# Altium project Ethernet-Tester-v1.0.PrjPcb (part 4 of 5)

## Sheet PoE-Sheet.SchDoc
size A4; SheetNumber: 8; SheetTotal: 9
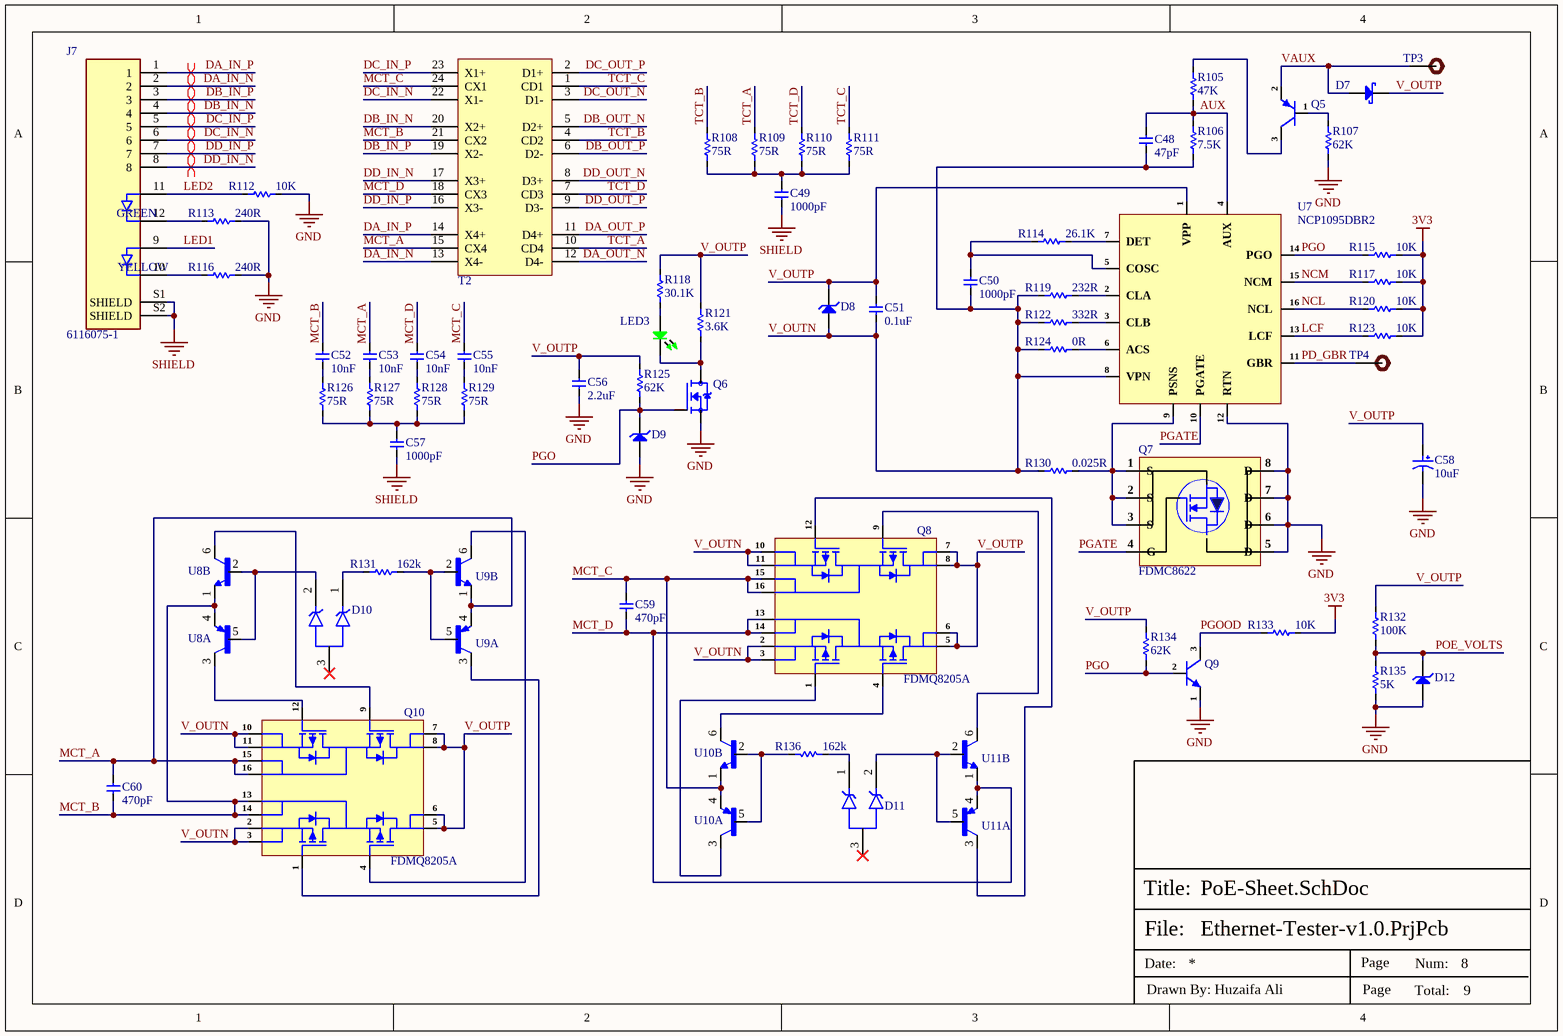
[diagram p7: PoE-Sheet.SchDoc]

### Parts
C48  47pF  [Cap-0603]
C49  1000pF  [Cap-1206]
C50  1000pF  [Cap-0603]
C51  0.1uF  [Cap-0805]
C52  10nF  [Cap-0402]
C53  10nF  [Cap-0402]
C54  10nF  [Cap-0402]
C55  10nF  [Cap-0402]
C56  2.2uF  [Cap-0805]
C57  1000pF  [Cap-1206]
C58  10uF  [EEE-FK1K100XP]
C59  470pF  [Cap-0805]
C60  470pF  [Cap-0805]
D7  SS26  [SMA(DO-214AC)]  (value not drawn)
D8  SMBJ58A-13-F  [SMB_]  (value not drawn)
D9  1SMA5930BT3G  [SMA]  (value not drawn)
D10  MMBZ27VALT1G  [SOT95P237X111-3N]  (value not drawn)
D11  MMBZ27VALT1G  [SOT95P237X111-3N]  (value not drawn)
D12  MM3Z3V3B  [SOD323F]  (value not drawn)
J7  6116075-1  [TE_6116075-1]
LED3  Emerald  [LED-0603]  (value not drawn)
Q5  BC856B  [SOT-23]  (value not drawn)
Q6  2N7002LT1G  [SOT95P240X111-3N]  (value not drawn)
Q7  FDMC8622  [8-MLP (3.3x3.3)]
Q8  FDMQ8205A  [12-MLP (5x4.5)]
Q9  MMBT3904  [SOT-23]  (value not drawn)
Q10  FDMQ8205A  [12-MLP (5x4.5)]
R105  47K  [Res-0402]
R106  7.5K  [Res-0402]
R107  62K  [Res-0603]
R108  75R  [Res-0402]
R109  75R  [Res-0402]
R110  75R  [Res-0402]
R111  75R  [Res-0402]
R112  10K  [Res-0402]
R113  240R  [Res-0402]
R114  26.1K  [Res-0402]
R115  10K  [Res-0402]
R116  240R  [Res-0402]
R117  10K  [Res-0402]
R118  30.1K  [Res-0603]
R119  232R  [Res-0402]
R120  10K  [Res-0402]
R121  3.6K  [Res-1206]
R122  332R  [Res-0402]
R123  10K  [Res-0402]
R124  0R  [Res-0402]
R125  62K  [Res-0603]
R126  75R  [Res-0402]
R127  75R  [Res-0402]
R128  75R  [Res-0402]
R129  75R  [Res-0402]
R130  0.025R  [Res-1206]
R131  162k  [Res-0402]
R132  100K  [Res-0402]
R133  10K  [Res-0402]
R134  62K  [Res-0603]
R135  5K  [Res-0402]
R136  162k  [Res-0402]
T2  1000 Base-T, 1 Port  [7490220123]  (value not drawn)
TP3  0.5mm Test Pad  [0.5mm Test Pad]  (value not drawn)  (no BOM)
TP4  TEST POINT 0.5mm Dia  [Test-point - 0.5mm]  (value not drawn)  (no BOM)
U7  NCP1095DBR2  [TSSOP_16]
U8  BC846BPDW1T1G  [SOT65P210X110-6N]  (value not drawn)  (parts A,B of 2)
U9  BC846BPDW1T1G  [SOT65P210X110-6N]  (value not drawn)  (parts A,B of 2)
U10  BC846BPDW1T1G  [SOT65P210X110-6N]  (value not drawn)  (parts A,B of 2)
U11  BC846BPDW1T1G  [SOT65P210X110-6N]  (value not drawn)  (parts A,B of 2)

### Nets
3V3: R115.2 R117.2 R120.2 R123.2 R133.2
GND: C56.1 C58.2 D9.2(A) D12.1(A) Q6.2(S) Q7.5(D) Q7.6(D) Q7.7(D) Q7.8(D) Q9.1(E) R107.1 R112.2 R113.2 R116.2 R135.1 U7.12(RTN)
SHIELD: C49.1 C57.1 J7.S1(SHIELD) J7.S2(SHIELD)
AUX: C48.2 R105.1 R106.2 U7.4(AUX)
DA_IN_N: J7.2 T2.13(X4-)
DA_IN_P: J7.1 T2.14(X4+)
DA_OUT_N: T2.12(D4-)
DA_OUT_P: T2.11(D4+)
DB_IN_N: J7.4 T2.20(X2+)
DB_IN_P: J7.3 T2.19(X2-)
DB_OUT_N: T2.5(D2+)
DB_OUT_P: T2.6(D2-)
DC_IN_N: J7.6 T2.22(X1-)
DC_IN_P: J7.5 T2.23(X1+)
DC_OUT_N: T2.3(D1-)
DC_OUT_P: T2.2(D1+)
DD_IN_N: J7.8 T2.17(X3+)
DD_IN_P: J7.7 T2.16(X3-)
DD_OUT_N: T2.8(D3+)
DD_OUT_P: T2.9(D3-)
LCF: R123.1 U7.13(LCF)
LED1: J7.9(LED_YELLOW_ANODE)
LED2: J7.11(LED_GREEN_ANODE) R112.1
MCT_A: C53.2 C60.2 Q10.15(INPUT2) Q10.16(INPUT2) T2.15(CX4) U9.1(E2) U9.4(E1)
MCT_B: C52.2 C60.1 Q10.13(INPUT1) Q10.14(INPUT1) T2.21(CX2) U8.1(E2) U8.4(E1)
MCT_C: C55.2 C59.2 Q8.15(INPUT2) Q8.16(INPUT2) T2.24(CX1) U10.1(E2) U10.4(E1)
MCT_D: C54.2 C59.1 Q8.13(INPUT1) Q8.14(INPUT1) T2.18(CX3) U11.1(E2) U11.4(E1)
NCL: R120.1 U7.16(NCL)
NCM: R117.1 U7.15(NCM)
PD_GBR: TP4.1 U7.11(GBR)
PGATE: Q7.4(G) U7.10(PGATE)
PGO: D9.1(K) Q6.1(G) Q9.2(B) R115.1 R125.1 R134.2 U7.14(PGO)
PGOOD: Q9.3(C) R133.1
POE_VOLTS: D12.2(K) R132.1 R135.2
TCT_A: R109.2 T2.10(CD4)
TCT_B: R108.2 T2.4(CD2)
TCT_C: R111.2 T2.1(CD1)
TCT_D: R110.2 T2.7(CD3)
V_OUTN: C48.1 C50.1 C51.1 D8.1(A) Q8.2(OUTN) Q8.3(OUTN) Q8.10(OUTN) Q8.11(OUTN) Q10.2(OUTN) Q10.3(OUTN) Q10.10(OUTN) Q10.11(OUTN) R106.1 R119.1 R122.1 R124.1 R130.1 U7.8(VPN)
V_OUTP: C51.2 C56.2 C58.1 D7.1(K) D8.2(K) Q8.5(OUTP) Q8.6(OUTP) Q8.7(OUTP) Q8.8(OUTP) Q10.5(OUTP) Q10.6(OUTP) Q10.7(OUTP) Q10.8(OUTP) R118.2 R121.2 R125.2 R132.2 R134.1 U7.1(VPP)
VAUX: D7.2(A) Q5.2(E) TP3.1
NetC49_2: C49.2 R108.1 R109.1 R110.1 R111.1
NetC50_2: C50.2 R114.1 U7.5(COSC)
NetC52_1: C52.1 R126.2
NetC53_1: C53.1 R127.2
NetC54_1: C54.1 R128.2
NetC55_1: C55.1 R129.2
NetC57_2: C57.2 R126.1 R127.1 R128.1 R129.1
NetD10_1: D10.1(K1) R131.1
NetD10_2: D10.2(K2) U8.2(B2) U8.5(B1)
NetD11_1: D11.1(K1) R136.1
NetD11_2: D11.2(K2) U11.2(B2) U11.5(B1)
NetJ7_10: J7.10(LED_YELLOW_CATHODE) R116.1
NetJ7_12: J7.12(LED_GREEN_CATHODE) R113.1
NetLED3_1: LED3.1 R118.1
NetLED3_2: LED3.2 Q6.3(D) R121.1
NetQ5_1: Q5.1(B) R107.2
NetQ5_3: Q5.3(C) R105.2
NetQ7_1: Q7.1(S) Q7.2(S) Q7.3(S) R130.2 U7.9(PSNS)
NetQ8_1: Q8.1(G1) U10.3(C1)
NetQ8_4: Q8.4(G2) U10.6(C2)
NetQ8_9: Q8.9(G3) U11.6(C2)
NetQ8_12: Q8.12(G4) U11.3(C1)
NetQ10_1: Q10.1(G1) U9.3(C1)
NetQ10_4: Q10.4(G2) U9.6(C2)
NetQ10_9: Q10.9(G3) U8.6(C2)
NetQ10_12: Q10.12(G4) U8.3(C1)
NetR114_2: R114.2 U7.7(DET)
NetR119_2: R119.2 U7.2(CLA)
NetR122_2: R122.2 U7.3(CLB)
NetR124_2: R124.2 U7.6(ACS)
NetR131_2: R131.2 U9.2(B2) U9.5(B1)
NetR136_2: R136.2 U10.2(B2) U10.5(B1)

Not connected (* = marked no-connect by the designer): D10 3(A)*; D11 3(A)*

### Layout directives
differential pair: DA_IN_N, DA_IN_P, DB_IN_N, DB_IN_P, DC_IN_N, DC_IN_P, DD_IN_N, DD_IN_P

### Notes on the sheet
- File:
- Title:
- Date:
- Page
- Num:
- Total:
- Drawn By: Huzaifa Ali
- (in symbol 6116075-1) GREEN; YELLOW

### Library data of the parts
C48 = CC0603FRNPO9BN470: CAP CER 47PF 50V NPO 0603; Manufacturer: Yageo; Item Type: Capacitor; Supplier: Digikey; LCSC Part Number: C519486; Manufacturer Part Number: CC0603FRNPO9BN470; RoHS: Yes; Stock: 37282; Pricing: 1=0.19, 10=0.126, 50=0.0756, 100=0.0594, 500=0.0439, 1000=0.03634 (USD); ComponentLink1URL: https://datasheet.ciiva.com/5425/upy-gp-np0-16v-to-50v-8-5425545.pdf?src-supplier=Mouser; ComponentLink1Description: https://datasheet.ciiva.com/5425/upy-gp-np0-16v-to-50v-8-5425545.pdf?src-supplier=Mouser; ComponentLink2URL: https://datasheet.ciiva.com/11586/upy-gp-np0-16v-to-50v-8-11586472.pdf?src-supplier=Avnet; ComponentLink2Description: https://datasheet.ciiva.com/11586/upy-gp-np0-16v-to-50v-8-11586472.pdf?src-supplier=Avnet
C49 C57 = CC1206KKX7RDBB102: CAP CER 1000PF 2KV X7R 1206; Manufacturer: Yageo; Tolerance: 10%; Capacitance: 1nF; Dissipation Factor: 2.5%; Insulation Resistance: 10GR; Item Type: Capacitor; Supplier 1: Digi-Key; Manufacturer Part Number: CC1206KKX7RDBB102; RoHS: Yes; Category: Ceramic Capacitors; Stock 1: 19260; Pricing 1: 1=0.35000, 10=0.24000, 50=0.16780, 100=0.14390, 500=0.10794, 1000=0.09114 (USD); Mount: Surface Mount; Case/Package: 1206; Number of Pins: 2; Case Code (Metric): 3216; Case Code (Imperial): 1206; Min Operating Temperature: -55°C; Max Operating Temperature: 125°C; Dielectric: X7R; Voltage: 2kV; Package Quantity: 1; Voltage Rating: 2kV; Packaging: Tape and Reel; Voltage Rating (DC): 2kV; Termination: SMD/SMT; Resistor Type: Ceramic; Series: CC; Construction: Flat; Length: 3.2mm; Width: 0.063inch; Height: 1.25mm; Depth: 1.6mm; Thickness: 0.057inch; Radiation Hardening: No; RoHS Compliant: Yes; REACH SVHC: Unknown; Lead Free: Lead Free; ComponentLink1URL: https://datasheet.ciiva.com/23942/1449957-23942422.pdf?src-supplier=Newark; ComponentLink1Description: https://datasheet.ciiva.com/23942/1449957-23942422.pdf?src-supplier=Newark; ComponentLink2URL: https://datasheet.ciiva.com/186/upy-np0x7r-hv-1kv-to-3kv-4-186736.pdf?src-supplier=Digi-Key; ComponentLink2Description: https://datasheet.ciiva.com/186/upy-np0x7r-hv-1kv-to-3kv-4-186736.pdf?src-supplier=Digi-Key; ComponentLink3URL: https://datasheet.ciiva.com/186/upy-np0x7r-hv-1kv-to-3kv-4-186737.pdf?src-supplier=Digi-Key; ComponentLink3Description: https://datasheet.ciiva.com/186/upy-np0x7r-hv-1kv-to-3kv-4-186737.pdf?src-supplier=Digi-Key; ComponentLink4URL: https://datasheet.ciiva.com/13386/upy-gp-np0-16v-to-50v-8-13386312.pdf?src-supplier=Mouser; ComponentLink4Description: https://datasheet.ciiva.com/13386/upy-gp-np0-16v-to-50v-8-13386312.pdf?src-supplier=Mouser; ComponentLink5URL: https://datasheet.ciiva.com/186/upy-np0x7r-hv-1kv-to-3kv-4-186735.pdf?src-supplier=Digi-Key; ComponentLink5Description: https://datasheet.ciiva.com/186/upy-np0x7r-hv-1kv-to-3kv-4-186735.pdf?src-supplier=Digi-Key; Supplier Part Number 1: 311-1487-1-ND; LCSC Part Number: C23631
C50 = CL10C102JB8NNNC: CAP CER 1000PF 50V C0G/NP0 0603; Manufacturer: Samsung; Material: Ceramic; Tolerance: 5%; Capacitance: 1nF; Dielectric: C0G; Temperature Coefficient: 300ppm/°C; Item Type: Capacitor; Supplier 1: RSComponents; Manufacturer Part Number: CL10C102JB8NNNC; RoHS: Yes; Category: Ceramic Capacitors; Stock 1: 616000; Pricing 1: 4000=0.00600, 12000=0.00600, 20000=0.00600, 40000=0.00500, 100000=0.00500 (GBP); Mount: Surface Mount; Case/Package: 0603; Case Code (Metric): 1608; Case Code (Imperial): 0603; Min Operating Temperature: -55°C; Max Operating Temperature: 125°C; Voltage: 50V; Voltage Rating (DC): 50V; Voltage Rating: 50V; Packaging: Tape and Reel; Package Quantity: 1; Series: CL; Length: 1.6mm; Width: 0.031inch; Height: 0.8mm; Depth: 0.8mm; Thickness: 0.035inch; Radiation Hardening: No; Lead Free: Lead Free; RoHS Compliant: Yes; ComponentLink1URL: https://datasheet.ciiva.com/15195/getdatasheetpartid-354056-15195790.pdf?src-supplier=Verical; ComponentLink1Description: https://datasheet.ciiva.com/15195/getdatasheetpartid-354056-15195790.pdf?src-supplier=Verical; ComponentLink2URL: https://datasheet.ciiva.com/29198/458273-da-01-en-vs-kondensator-0603-29198494.pdf?src-supplier=Conrad; ComponentLink2Description: https://datasheet.ciiva.com/29198/458273-da-01-en-vs-kondensator-0603-29198494.pdf?src-supplier=Conrad; ComponentLink3URL: https://datasheet.ciiva.com/26310/mlcc-catalogdownload2013-eng-26310329.pdf?src-supplier=Distrelec; ComponentLink3Description: https://datasheet.ciiva.com/26310/mlcc-catalogdownload2013-eng-26310329.pdf?src-supplier=Distrelec; Supplier Part Number 1: 7665279; LCSC Part Number: C163508
C51 = CC0805KKX7R0BB104: CAP CER 0.1UF 100V X7R 0805; Manufacturer: Yageo; Item Type: Capacitor; Tolerance: 10%; Value: 100nF; Supplier: Digikey; LCSC Part Number: C106243; Manufacturer Part Number: CC0805KKX7R0BB104; RoHS: Yes; Stock: 52345; Pricing: 1=0.19, 10=0.126, 50=0.0756, 100=0.0594, 500=0.0439, 1000=0.03634 (USD); Mounting Technology: Surface Mount; Case/Package: 0805; Case Code (Imperial): 0805; Case Code (Metric): 2012; Weight: 0.000194oz; Min Operating Temperature: -55°C; Max Operating Temperature: 125°C; Dielectric: X7R; Packaging: Tape and Reel; Voltage Rating (DC): 100V; Voltage Rating: 100V; Termination: SMD/SMT; Voltage: 100V; Series: CC; Lead Free: Lead Free; RoHS Compliant: Yes; ComponentLink1URL: https://media.digikey.com/pdf/Data%20Sheets/Yageo%20PDFs/NPO,%20X7R%20Mid-voltage.pdf?src-supplier=Digikey; ComponentLink1Description: https://media.digikey.com/pdf/Data%20Sheets/Yageo%20PDFs/NPO,%20X7R%20Mid-voltage.pdf?src-supplier=Digikey; ComponentLink2URL: http://www.mouser.com/ds/2/447/Yageo_UPY-GP_NP0_16V-to-50V_9-358835.pdf?src-supplier=Mouser; ComponentLink2Description: http://www.mouser.com/ds/2/447/Yageo_UPY-GP_NP0_16V-to-50V_9-358835.pdf?src-supplier=Mouser; ComponentLink3URL: http://www.yageo.com/documents/recent/UPY-NP0X7R_MV_100-to-630V_21.pdf?src-supplier=Digikey; ComponentLink3Description: http://www.yageo.com/documents/recent/UPY-NP0X7R_MV_100-to-630V_21.pdf?src-supplier=Digikey; ComponentLink4URL: https://datasheet.octopart.com/CC0805KKX7R0BB104-Yageo-datasheet-101324229.pdf?src-supplier=Newark; ComponentLink4Description: https://datasheet.octopart.com/CC0805KKX7R0BB104-Yageo-datasheet-101324229.pdf?src-supplier=Newark; ComponentLink5URL: https://datasheet.octopart.com/CC0805KKX7R0BB104-Yageo-datasheet-166511530.pdf?src-supplier=Future+Electronics; ComponentLink5Description: https://datasheet.octopart.com/CC0805KKX7R0BB104-Yageo-datasheet-166511530.pdf?src-supplier=Future+Electronics
C52-C55 = CC0402KRX7R0BB103: CAP CER 10000PF 100V X7R 0402; Manufacturer: Yageo; Item Type: Capacitors; Material: Ceramic; Tolerance: 10%; Supplier: Arrow Electronics; LCSC Part Number: C527014; Manufacturer Part Number: CC0402KRX7R0BB103; RoHS: Yes; Stock: 60000; Pricing: 10000=0.0098, 20000=0.0097, 30000=0.0092, 50000=0.0091, 100000=0.009, 250000=0.0089 (USD); Case/Package: 0402; Min Operating Temperature: -55°C; Max Operating Temperature: 125°C; Value: 10nF; Voltage Rating: 100V; Height: 550um; RoHS Compliant: Yes; ComponentLink1URL: https://datasheet.octopart.com/CC0402KRX7R0BB103-Yageo-datasheet-166511530.pdf?src-supplier=Future+Electronics; ComponentLink1Description: https://datasheet.octopart.com/CC0402KRX7R0BB103-Yageo-datasheet-166511530.pdf?src-supplier=Future+Electronics; ComponentLink2URL: https://datasheet.octopart.com/CC0402KRX7R0BB103-Yageo-datasheet-153410991.pdf?src-supplier=Farnell; ComponentLink2Description: https://datasheet.octopart.com/CC0402KRX7R0BB103-Yageo-datasheet-153410991.pdf?src-supplier=Farnell
C56 = GRM21BD72A225KE01L: CAP CER 2.2UF 100V X7T 0805; Manufacturer: Murata; Item Type: Capacitor; Supplier 1: Digi-Key; Manufacturer Part Number: GRM21BD72A225KE01L; RoHS: No; Category: Ceramic Capacitors; Stock 1: 2439; Pricing 1: 1=0.55000, 10=0.38600, 50=0.29220, 100=0.25440, 500=0.18846, 1000=0.16020 (USD); RoHS Compliant: Yes; LCSC Part Number: C2981733; ComponentLink1Description: LCSC; ComponentLink1URL: https://www.lcsc.com/product-detail/Multilayer-Ceramic-Capacitors-MLCC-SMD-SMT_Murata-Electronics-GRM21BD72A225KE01L_C2981733.html; Supplier Part Number 1: 490-GRM21BD72A225KE01LCT-ND
C58 = EEE-FK1K100XP: CAP ALUM 10UF 20% 80V SMD; Manufacturer: Panasonic; Item Type: Capacitors; Supplier: Mouser; LCSC Part Number: C178553; Manufacturer Part Number: EEE-FK1K100XP; RoHS: Yes; Stock: 3728; Pricing: 1=0.68, 10=0.368, 50=0.368, 100=0.277, 1000=0.185, 10000=0.157 (USD); ComponentLink1URL: https://datasheet.ciiva.com/11783/0900766b80e4e8b0-11783480.pdf?src-supplier=Rs; ComponentLink1Description: https://datasheet.ciiva.com/11783/0900766b80e4e8b0-11783480.pdf?src-supplier=Rs; ComponentLink2URL: https://datasheet.ciiva.com/48523/fk-eng-tds-48523894.pdf?src-supplier=Distrelec; ComponentLink2Description: https://datasheet.ciiva.com/48523/fk-eng-tds-48523894.pdf?src-supplier=Distrelec; ComponentLink3URL: https://datasheet.ciiva.com/28670/731857-28670589.pdf?src-supplier=Element14; ComponentLink3Description: https://datasheet.ciiva.com/28670/731857-28670589.pdf?src-supplier=Element14; ComponentLink4URL: https://datasheet.ciiva.com/14602/70258115-14602415.pdf?src-supplier=Allied+Electronics; ComponentLink4Description: https://datasheet.ciiva.com/14602/70258115-14602415.pdf?src-supplier=Allied+Electronics; ComponentLink5URL: https://datasheet.ciiva.com/14606/70258115-14606165.pdf?src-supplier=Allied+Electronics; ComponentLink5Description: https://datasheet.ciiva.com/14606/70258115-14606165.pdf?src-supplier=Allied+Electronics; ComponentLink6URL: https://datasheet.ciiva.com/2985/aba0000ce120-2985457.pdf?src-supplier=Avnet; ComponentLink6Description: https://datasheet.ciiva.com/2985/aba0000ce120-2985457.pdf?src-supplier=Avnet; ComponentLink7URL: https://datasheet.ciiva.com/6121/1676921-6121193.pdf?src-supplier=Farnell; ComponentLink7Description: https://datasheet.ciiva.com/6121/1676921-6121193.pdf?src-supplier=Farnell; ComponentLink8URL: https://datasheet.ciiva.com/15166/getdatasheetpartid-191532-15166315.pdf?src-supplier=Verical; ComponentLink8Description: https://datasheet.ciiva.com/15166/getdatasheetpartid-191532-15166315.pdf?src-supplier=Verical
C59 C60 = CC0805KRX7RBBB471: CAP CER 470PF 500V X7R 0805; Manufacturer: Yageo; Item Type: Capacitors; Tolerance: 10%; Supplier: Arrow Electronics; LCSC Part Number: C113867; Manufacturer Part Number: CC0805KRX7RBBB471; RoHS: Yes; Stock: 16000; Pricing: 4000=0.0157, 8000=0.0139, 24000=0.013, 48000=0.0125, 100000=0.0094 (USD); Mounting Technology: Surface Mount; Case/Package: 0805; Case Code (Imperial): 0805; Case Code (Metric): 2012; Min Operating Temperature: -55°C; Max Operating Temperature: 125°C; Voltage Rating (DC): 500V; Value: 470pF; Packaging: Tape and Reel; Package Quantity: 4000; Dielectric: X7R; Voltage Rating: 500V; Series: CC; Length: 0.079inch; Width: 0.049inch; Thickness: 0.037inch; RoHS Compliant: Yes; ComponentLink1URL: http://www.mouser.com/ds/2/447/Yageo_UPY-GP_NP0_16V-to-50V_9-358835.pdf?src-supplier=Mouser; ComponentLink1Description: http://www.mouser.com/ds/2/447/Yageo_UPY-GP_NP0_16V-to-50V_9-358835.pdf?src-supplier=Mouser; ComponentLink2URL: https://www.yageo.com/upload/media/product/products/datasheet/mlcc/UPY-NP0X7R_MV_100-to-630V_21.pdf?src-supplier=Digikey; ComponentLink2Description: https://www.yageo.com/upload/media/product/products/datasheet/mlcc/UPY-NP0X7R_MV_100-to-630V_21.pdf?src-supplier=Digikey; ComponentLink3URL: http://www.yageo.com/documents/recent/UPY-NP0X7R_MV_100-to-630V_19.pdf?src-supplier=Digikey; ComponentLink3Description: http://www.yageo.com/documents/recent/UPY-NP0X7R_MV_100-to-630V_19.pdf?src-supplier=Digikey
D7 = SS26: 60V 700mV@2A 2A SMA(DO-214AC) Schottky Barrier Diodes (SBD) ROHS; Manufacturer: MDD; Item Type: Diode; Manufacturer Part Number: SS26; Package: SMA(DO-214AC); LCSC Part Number: C14238; ComponentLink1Description: LCSC; ComponentLink1URL: https://www.lcsc.com/product-detail/Schottky-Barrier-Diodes-SBD_MDD-Microdiode-Electronics-SS26_C14238.html
D8 = SMBJ58A-13-F: TVS DIODE 58VWM 93.6VC SMB; Manufacturer: Diodes; Supplier: Future Electronics; LCSC Part Number: C135085; Manufacturer Part Number: SMBJ58A-13-F; RoHS: Yes; Item Type: Diode; Stock: 6000; Pricing: 3000=0.0711, 9000=0.0684, 15000=0.0671, 30000=0.0655, 60000=0.063 (USD); ComponentLink1URL: https://datasheet.ciiva.com/25624/0900766b8104bed2-25624843.pdf?src-supplier=Rs; ComponentLink1Description: https://datasheet.ciiva.com/25624/0900766b8104bed2-25624843.pdf?src-supplier=Rs; ComponentLink2URL: https://datasheet.ciiva.com/15143/getdatasheetpartid-39642-15143045.pdf?src-supplier=Verical; ComponentLink2Description: https://datasheet.ciiva.com/15143/getdatasheetpartid-39642-15143045.pdf?src-supplier=Verical; ComponentLink3URL: https://datasheet.ciiva.com/4520/ds19002-4520617.pdf?src-supplier=Mouser; ComponentLink3Description: https://datasheet.ciiva.com/4520/ds19002-4520617.pdf?src-supplier=Mouser; ComponentLink4URL: https://datasheet.ciiva.com/16393/ds19002-16393005.pdf?src-supplier=Future+Electronics; ComponentLink4Description: https://datasheet.ciiva.com/16393/ds19002-16393005.pdf?src-supplier=Future+Electronics
D9 = 1SMA5930BT3G: DIODE ZENER 16V 1.5W SMA; Manufacturer: onsemi; Item Type: Zener diode; Manufacturer Part Number: 1SMA5930BT3G; Package: SMA; LCSC Part Number: C128848; ComponentLink1Description: LCSC; ComponentLink1URL: https://www.lcsc.com/product-detail/Zener-Diodes_onsemi-1SMA5930BT3G_C128848.html
D10 D11 = MMBZ27VALT1G: 46V Clamp 870mA Ipp Tvs Diode Surface Mount SOT-23-3 (TO-236); Package: None; Price: None; Value: *; MP: MMBZ27VALT1G; Availability: Unavailable
D12 = MM3Z3V3B: DIODE ZENER 3.3V 200MW SOD323F; Manufacturer: ON Semiconductor / Fairchild; Forward Voltage: 1V; Tolerance: 2%; Impedance: 89R; Max Reverse Leakage Current: 4.5uA; Test Current: 5mA; Element Configuration: Single; Supplier 1: Digi-Key; Manufacturer Part Number: MM3Z3V3B; Stock 1: 473644; Pricing 1: 1=0.22, 10=0.18, 100=0.0956, 500=0.06288, 1000=0.04276 (USD); Mount: Surface Mount; Number of Pins: 2; Weight: 0.0276g; Min Operating Temperature: -65°C; Max Operating Temperature: 150°C; Packaging: Tape and Reel; Package Quantity: 1; Max Power Dissipation: 200mW; Zener Voltage: 3.3V; Voltage Tolerance: 2%; Power Dissipation: 200mW; Working Voltage: 3.3V; Peak Reverse Current: 4.5uA; Length: 1.3mm; Height: 1mm; Width: 1.7mm; Radiation Hardening: No; REACH SVHC: No SVHC; Lead Free: Lead Free; ComponentLink1URL: http://www.onsemi.com/pub/Collateral/MM3Z9V1B-D.pdf?src-supplier=Digi-Key; ComponentLink1Description: http://www.onsemi.com/pub/Collateral/MM3Z9V1B-D.pdf?src-supplier=Digi-Key; ComponentLink2URL: http://www.mouser.com/ds/2/149/MM3Z3V3B-187166.pdf?src-supplier=Mouser; ComponentLink2Description: http://www.mouser.com/ds/2/149/MM3Z3V3B-187166.pdf?src-supplier=Mouser; ComponentLink3URL: https://www.fairchildsemi.com/datasheets/MM/MM3Z9V1B.pdf?src-supplier=Avnet; ComponentLink3Description: https://www.fairchildsemi.com/datasheets/MM/MM3Z9V1B.pdf?src-supplier=Avnet; ComponentLink4URL: http://www.farnell.com/datasheets/1706525.pdf?src-supplier=Element14; ComponentLink4Description: http://www.farnell.com/datasheets/1706525.pdf?src-supplier=Element14; Supplier Part Number 1: MM3Z3V3BCT-ND; LCSC Part Number: C2978865; Item Type: Diode
J7 = 6116075-1: Conn Telephone/Telecom F 8 POS 2.54mm Solder RA Thru-Hole 12 Terminal 1 Port Tray; MF: TE Connectivity; Value: *; TE_purchase_URL: https://www.te.com/usa-en/product-6116075-1.html?te_bu=Cor&te_type=disp&te_campaign=seda_glo_cor-seda-global-disp-prtnr-fy19-seda-model-bom-cta_sma-317_1&elqCampaignId=32493; Package: None; Digi-Key_Purchase_URL: https://www.digikey.com.tr/product-detail/en/te-connectivity-amp-connectors/6116075-1/A130943-ND/2262413?utm_source=snapeda&utm_medium=aggregator&utm_campaign=symbol; SnapEDA_Link: https://www.snapeda.com/parts/6116075-1/TE%20Connectivity%20AMP%20Connectors/view-part/2744115/?ref=snap; Digi-Key_Part_Number: A130943-ND; MP: 6116075-1
LED3 = NCD0603G2: Emerald 0603 Light Emitting Diodes (LED) ROHS; Manufacturer: Foshan NationStar Optoelectronics; Manufacturer Part Number: NCD0603G2; Package: 0603; LCSC Part Number: C87326; Item Type: LED; ComponentLink1Description: LCSC; ComponentLink1URL: https://www.lcsc.com/product-detail/Light-Emitting-Diodes-LED_Foshan-NationStar-Optoelectronics-NCD0603G2_C87326.html
Q5 = BC856B: 65V 200mW 220@2mA,5V 100mA PNP SOT-23 Bipolar Transistors - BJT ROHS; Manufacturer: Guangdong Hottech; Manufacturer Part Number: BC856B; Package: SOT-23; LCSC Part Number: C181144; Item Type: Transistors; ComponentLink1Description: LCSC; ComponentLink1URL: https://www.lcsc.com/product-detail/Bipolar-Transistors-BJT_Guangdong-Hottech-BC856B_C181144.html
Q6 = 2N7002LT1G: N-Channel 60 V 115mA (Tc) 225mW (Ta) Surface Mount SOT-23-3 (TO-236); MF: ON Semiconductor; Price: None; Availability: In Stock; Package: SOT-23-3 ON Semiconductor; MP: 2N7002LT1G; Value: *; SnapEDA_Link: https://www.snapeda.com/parts/2N7002LT1G/Onsemi/view-part/?ref=snap; Purchase-URL: https://pricing.snapeda.com/search/part/2N7002LT1G/?ref=eda; Check_prices: https://www.snapeda.com/parts/2N7002LT1G/Onsemi/view-part/?ref=eda
Q7 = FDMC8622: MOSFET N-CH 100V 4A/16A 8MLP; Manufacturer: ON Semiconductor / Fairchild; Item Type: MOSFETs; Supplier: Digikey; LCSC Part Number: C463717; Manufacturer Part Number: FDMC8622; RoHS: Yes; Stock: 31990; Pricing: 1=1.72, 10=1.162, 100=0.822, 500=0.67044, 1000=0.62092 (USD); ComponentLink1URL: https://datasheet.ciiva.com/6369/fdmc8622-6369384.pdf?src-supplier=Digikey; ComponentLink1Description: https://datasheet.ciiva.com/6369/fdmc8622-6369384.pdf?src-supplier=Digikey; ComponentLink2URL: https://datasheet.ciiva.com/4438/fdmc8622-78408-4438454.pdf?src-supplier=Mouser; ComponentLink2Description: https://datasheet.ciiva.com/4438/fdmc8622-78408-4438454.pdf?src-supplier=Mouser; ComponentLink3URL: https://datasheet.ciiva.com/25625/0900766b810c963b-25625703.pdf?src-supplier=Rs; ComponentLink3Description: https://datasheet.ciiva.com/25625/0900766b810c963b-25625703.pdf?src-supplier=Rs; ComponentLink4URL: https://datasheet.ciiva.com/23705/1730099-23705419.pdf?src-supplier=Newark; ComponentLink4Description: https://datasheet.ciiva.com/23705/1730099-23705419.pdf?src-supplier=Newark; ComponentLink5URL: https://datasheet.ciiva.com/7967/1783755-7967984.pdf?src-supplier=Element14; ComponentLink5Description: https://datasheet.ciiva.com/7967/1783755-7967984.pdf?src-supplier=Element14; ComponentLink6URL: https://datasheet.ciiva.com/6369/fdmc8622-6369387.pdf?src-supplier=Digikey; ComponentLink6Description: https://datasheet.ciiva.com/6369/fdmc8622-6369387.pdf?src-supplier=Digikey; ComponentLink7URL: https://datasheet.ciiva.com/6369/fdmc8622-6369390.pdf?src-supplier=Digikey; ComponentLink7Description: https://datasheet.ciiva.com/6369/fdmc8622-6369390.pdf?src-supplier=Digikey
Q8 Q10 = FDMQ8205A: GREENBRIDGETM 2 SERIES OF HIGH-E; Manufacturer: ON Semiconductor / Fairchild; Item Type: Mosfet; FET Type: N and P-Channel; Operating Supply Current: 400uA; Max Power Dissipation: 780mW; Max Supply Voltage: 57V; Number of Outputs: 2NUMBER; Supplier: Mouser; Supplier Part Number: 512-FDMQ8205A; Manufacturer Part Number: FDMQ8205A; RoHS: Yes; Stock: 84; Pricing: 1=3.2, 10=2.69, 50=2.69, 100=2.18, 1000=1.66, 10000=1.56 (USD); Mounting Technology: Surface Mount; Weight: 0.21g; Min Operating Temperature: -40°C; Max Operating Temperature: 85°C; Packaging: Cut Tape; Series: GreenBridge™; Output Voltage: 57V; Height: 800um; RoHS Compliant: Yes; ComponentLink1URL: http://www.farnell.com/datasheets/2724479.pdf?src-supplier=Farnell; ComponentLink1Description: http://www.farnell.com/datasheets/2724479.pdf?src-supplier=Farnell; ComponentLink2URL: http://www.onsemi.com/pub/Collateral/FDMQ8205A-D.pdf?src-supplier=Digikey; ComponentLink2Description: http://www.onsemi.com/pub/Collateral/FDMQ8205A-D.pdf?src-supplier=Digikey; ComponentLink3URL: http://www.farnell.com/datasheets/2724479.pdf?src-supplier=Newark; ComponentLink3Description: http://www.farnell.com/datasheets/2724479.pdf?src-supplier=Newark
Q9 = MMBT3904: 40V 200mW 100 200mA NPN SOT-23 Bipolar (BJT) ROHS; Manufacturer: ElecSuper; Item Type: (BJT); Manufacturer Part Number: MMBT3904; Package: SOT-23; LCSC Part Number: C5249683; ComponentLink1Description: LCSC; ComponentLink1URL: https://www.lcsc.com/product-detail/Bipolar-BJT_ElecSuper-MMBT3904_C5249683.html
R105 = RC0402FR-0747KL: RES 47K OHM 1% 1/16W 0402; Manufacturer: Yageo; Power Rating: 62.5mW; Temperature Coefficient: 100ppm/°C; Voltage Rating: 50V; Resistance: 47kR; Max Power Dissipation: 63mW; Item Type: Resistor; Supplier 1: Avnet; Manufacturer Part Number: RC0402FR-0747KL; RoHS: Yes; Category: Chip SMD Resistors; Stock 1: 680000; Pricing 1: 10000=0.00085, 20000=0.00087, 40000=0.00084, 60000=0.00083, 80000=0.00079, 100000=0.00078, 1000000=0.00076 (USD); Case/Package: 0402; Case Code (Imperial): 0402; Case Code (Metric): 1005; Size Code: 0402; Min Operating Temperature: -55°C; Max Operating Temperature: 155°C; Tolerance: 1%; Series: RC; Packaging: Tape and Reel; Package Quantity: 1; Termination: SMD/SMT; Resistor Type: Thick Film; Number of Terminations: 2; Features: Moisture Resistant; Resistance Tolerance: 1%; Construction: Rectangular; Length: 1mm; Width: 0.02inch; Height: 0.016inch; Depth: 0.5mm; RoHS Compliant: Yes; Military Standard: Not; Lead Free: Lead Free; ComponentLink1URL: https://datasheet.ciiva.com/46412/1018594-46412839.pdf?src-supplier=Element14; ComponentLink1Description: https://datasheet.ciiva.com/46412/1018594-46412839.pdf?src-supplier=Element14; ComponentLink2URL: https://datasheet.ciiva.com/2453/pyu-r-int-thick-7-2453389.pdf?src-supplier=Digi-Key; ComponentLink2Description: https://datasheet.ciiva.com/2453/pyu-r-int-thick-7-2453389.pdf?src-supplier=Digi-Key; ComponentLink3URL: https://datasheet.ciiva.com/2453/pyu-r-int-thick-7-2453390.pdf?src-supplier=Digi-Key; ComponentLink3Description: https://datasheet.ciiva.com/2453/pyu-r-int-thick-7-2453390.pdf?src-supplier=Digi-Key; ComponentLink4URL: https://datasheet.ciiva.com/2453/pyu-r-int-thick-7-2453388.pdf?src-supplier=Digi-Key; ComponentLink4Description: https://datasheet.ciiva.com/2453/pyu-r-int-thick-7-2453388.pdf?src-supplier=Digi-Key; ComponentLink5URL: https://datasheet.ciiva.com/15189/getdatasheetpartid-323748-15189466.pdf?src-supplier=Verical; ComponentLink5Description: https://datasheet.ciiva.com/15189/getdatasheetpartid-323748-15189466.pdf?src-supplier=Verical; ComponentLink6URL: https://datasheet.ciiva.com/16793/pyu-rc0402-51-rohs-l-6-r-16793430.pdf?src-supplier=Future+Electronics; ComponentLink6Description: https://datasheet.ciiva.com/16793/pyu-rc0402-51-rohs-l-6-r-16793430.pdf?src-supplier=Future+Electronics; Supplier Part Number 1: RC0402FR-0747KL; LCSC Part Number: C93943
R106 = RC0402FR-077K5L: RES 7.5K OHM 1% 1/16W 0402; Manufacturer: Yageo; Resistance: 7.5kR; Power Rating: 63mW; Voltage Rating: 50V; Temperature Coefficient: 100ppm/°C; Item Type: Resistor; Supplier 1: Digi-Key; Manufacturer Part Number: RC0402FR-077K5L; RoHS: Yes; Category: Chip SMD Resistors; Stock 1: 1313734; Pricing 1: 1=0.10000, 10=0.01400, 100=0.00580, 1000=0.00262, 2500=0.00228, 5000=0.00188 (USD); Case/Package: 0402; Case Code (Metric): 1005; Case Code (Imperial): 0402; Size Code: 0402; Min Operating Temperature: -55°C; Max Operating Temperature: 155°C; Tolerance: 1%; Package Quantity: 1; Packaging: Tape and Reel; Resistor Type: Thick Film; Number of Terminations: 2; Termination: SMD/SMT; Max Power Dissipation: 63mW; Voltage Rating (DC): 50V; Features: Moisture Resistant; Series: RC; Resistance Tolerance: 1%; Construction: Rectangular; Length: 0.039inch; Width: 0.02inch; Height: 0.016inch; Depth: 0.5mm; Military Standard: Not; Lead Free: Lead Free; RoHS Compliant: Yes; ComponentLink1URL: https://datasheet.ciiva.com/7850/1018594-7850095.pdf?src-supplier=Element14; ComponentLink1Description: https://datasheet.ciiva.com/7850/1018594-7850095.pdf?src-supplier=Element14; ComponentLink2URL: https://datasheet.ciiva.com/7983/1018594-7983527.pdf?src-supplier=Element14; ComponentLink2Description: https://datasheet.ciiva.com/7983/1018594-7983527.pdf?src-supplier=Element14; ComponentLink3URL: https://datasheet.ciiva.com/46394/1018594-46394939.pdf?src-supplier=Element14; ComponentLink3Description: https://datasheet.ciiva.com/46394/1018594-46394939.pdf?src-supplier=Element14; ComponentLink4URL: https://datasheet.ciiva.com/2519/pyu-r-int-thick-7-2519058.pdf?src-supplier=Digi-Key; ComponentLink4Description: https://datasheet.ciiva.com/2519/pyu-r-int-thick-7-2519058.pdf?src-supplier=Digi-Key; ComponentLink5URL: https://datasheet.ciiva.com/2519/pyu-r-int-thick-7-2519059.pdf?src-supplier=Digi-Key; ComponentLink5Description: https://datasheet.ciiva.com/2519/pyu-r-int-thick-7-2519059.pdf?src-supplier=Digi-Key; ComponentLink6URL: https://datasheet.ciiva.com/2519/pyu-r-int-thick-7-2519057.pdf?src-supplier=Digi-Key; ComponentLink6Description: https://datasheet.ciiva.com/2519/pyu-r-int-thick-7-2519057.pdf?src-supplier=Digi-Key; ComponentLink7URL: https://datasheet.ciiva.com/12667/pyu-rc0402-51-rohs-l-6-r-12667366.pdf?src-supplier=Mouser; ComponentLink7Description: https://datasheet.ciiva.com/12667/pyu-rc0402-51-rohs-l-6-r-12667366.pdf?src-supplier=Mouser; ComponentLink8URL: https://datasheet.ciiva.com/16741/pyu-rc0402-51-rohs-l-6-r-16741132.pdf?src-supplier=Future+Electronics; ComponentLink8Description: https://datasheet.ciiva.com/16741/pyu-rc0402-51-rohs-l-6-r-16741132.pdf?src-supplier=Future+Electronics; ComponentLink9URL: https://datasheet.ciiva.com/15189/getdatasheetpartid-330684-15189510.pdf?src-supplier=Verical; ComponentLink9Description: https://datasheet.ciiva.com/15189/getdatasheetpartid-330684-15189510.pdf?src-supplier=Verical; Supplier Part Number 1: 311-7.50KLRCT-ND; LCSC Part Number: C137934
R107 R125 R134 = RT0603BRD0762KL: RES SMD 62K OHM 0.1% 1/10W 0603; Manufacturer: Yageo; Resistance: 62kR; Power Rating: 100mW; Voltage Rating: 75V; Temperature Coefficient: 25ppm/°C; Voltage Rating (DC): 50V; Item Type: Resistor; Supplier 1: Digi-Key; Manufacturer Part Number: RT0603BRD0762KL; RoHS: Yes; Category: Chip SMD Resistors; Stock 1: 20000; Pricing 1: 1=0.34000, 10=0.28800, 100=0.11260, 500=0.06812, 1000=0.04716, 2500=0.04322 (USD); Case/Package: 0603; Case Code (Imperial): 0603; Case Code (Metric): 1608; Weight: 7.1E-05oz; Contact Plating: Tin,Matte; Min Operating Temperature: -55°C; Max Operating Temperature: 125°C; Tolerance: 0.1%; Packaging: Tape and Reel; Package Quantity: 5000; Resistor Type: Thin Film; Termination: SMD/SMT; Number of Terminations: 2; Max Power Dissipation: 100mW; Features: Moisture Resistant; Series: RT; Construction: Rectangular; Length: 1.6mm; Width: 0.8mm; Height: 0.022inch; Depth: 0.8mm; Radiation Hardening: No; Military Standard: Not; Lead Free: Lead Free; RoHS Compliant: Yes; ComponentLink1URL: https://datasheet.ciiva.com/8888/pyu-rt-1-to-0-05-rohs-l-4-8888573.pdf?src-supplier=Avnet; ComponentLink1Description: https://datasheet.ciiva.com/8888/pyu-rt-1-to-0-05-rohs-l-4-8888573.pdf?src-supplier=Avnet; ComponentLink2URL: https://datasheet.ciiva.com/2586/pyu-rt-1-to-0-05-rohs-l-4-2586028.pdf?src-supplier=Digi-Key; ComponentLink2Description: https://datasheet.ciiva.com/2586/pyu-rt-1-to-0-05-rohs-l-4-2586028.pdf?src-supplier=Digi-Key; ComponentLink3URL: https://datasheet.ciiva.com/46635/pyu-rt-1-to-0-05-rohs-l-5-46635035.pdf?src-supplier=Digi-Key; ComponentLink3Description: https://datasheet.ciiva.com/46635/pyu-rt-1-to-0-05-rohs-l-5-46635035.pdf?src-supplier=Digi-Key; Supplier Part Number 1: YAG1707CT-ND; LCSC Part Number: C136961
R108-R111 R126-R129 = RC0402JR-0775RL: RES 75 OHM 5% 1/16W 0402; Manufacturer: Yageo; Item Type: Resistor; Temperature Coefficient: 100ppm/°C; Power Rating: 62.5mW; Voltage Rating: 50V; Max Power Dissipation: 63mW; Supplier: Digikey; Supplier Part Number: 311-75JRCT-ND; Manufacturer Part Number: RC0402JR-0775RL; RoHS: Yes; Stock: 2993323; Pricing: 1=0.1, 10=0.018, 50=0.0102, 100=0.0083, 500=0.00528, 1000=0.00444, 5000=0.00307 (USD); Case/Package: 0402; Pins: 2; Contact Plating: Tin,Lead; Case Code (Imperial): 0402; Case Code (Metric): 1005; Min Operating Temperature: -55°C; Max Operating Temperature: 155°C; Value: 75R; Tolerance: 5%; Resistor Type: Thick Film; Packaging: Tape and Reel; Termination: SMD/SMT; Voltage Rating (DC): 50V; Features: Moisture Resistant; Series: RC; Number of Terminations: 2; Resistance Tolerance: 5%; Length: 1mm; Width: 0.5mm; Height: 0.35mm; Reach SVHC Compliant: No; Lead Free: Lead Free; RoHS Compliant: Yes; ComponentLink1URL: https://datasheet.ciiva.com/7983/1018594-7983612.pdf?src-supplier=Element14; ComponentLink1Description: https://datasheet.ciiva.com/7983/1018594-7983612.pdf?src-supplier=Element14; ComponentLink2URL: https://datasheet.ciiva.com/17082/pyu-rc0402-51-rohs-l-6-r-17082239.pdf?src-supplier=Future+Electronics; ComponentLink2Description: https://datasheet.ciiva.com/17082/pyu-rc0402-51-rohs-l-6-r-17082239.pdf?src-supplier=Future+Electronics; LCSC Part Number: C137841
R112 R115 R117 R120 R123 R133 = RC0402FR-0710KL: RES 10K OHM 1% 1/16W 0402; Manufacturer: Yageo; Resistance: 10kR; Voltage Rating (DC): 50V; Temperature Coefficient: 100ppm/°C; Power Rating: 62.5mW; Max Power Dissipation: 63mW; Item Type: Resistor; Supplier 1: Mouser; Manufacturer Part Number: RC0402FR-0710KL; RoHS: Yes; Category: Chip SMD Resistors; Stock 1: 18648329; Pricing 1: 1=0.10000, 10=0.01400, 50=0.01400, 100=0.00500, 1000=0.00300, 10000=0.00200 (USD); Case/Package: 0402; Number of Pins: 2; Case Code (Imperial): 0402; Case Code (Metric): 1005; Min Operating Temperature: -55°C; Max Operating Temperature: 155°C; Resistor Type: Thick Film; Tolerance: 1%; Packaging: Tape and Reel; Voltage Rating: 50V; Termination: SMD/SMT; Working Voltage: 50V; Number of Terminations: 2; Features: Moisture Resistant; Series: RC; Resistance Tolerance: 1%; Construction: Rectangular; Length: 1mm; Width: 0.5mm; Height: 0.32mm; Depth: 0.5mm; Lead Pitch: 0.2mm; REACH SVHC: No SVHC; Lead Free: Lead Free; RoHS Compliant: Yes; Military Standard: Not; ComponentLink1URL: https://datasheet.ciiva.com/7660/38568-7660787.pdf?src-supplier=Element14; ComponentLink1Description: https://datasheet.ciiva.com/7660/38568-7660787.pdf?src-supplier=Element14; ComponentLink2URL: https://datasheet.ciiva.com/7849/1686128-7849814.pdf?src-supplier=Element14; ComponentLink2Description: https://datasheet.ciiva.com/7849/1686128-7849814.pdf?src-supplier=Element14; ComponentLink3URL: https://datasheet.ciiva.com/7983/1018594-7983486.pdf?src-supplier=Element14; ComponentLink3Description: https://datasheet.ciiva.com/7983/1018594-7983486.pdf?src-supplier=Element14; ComponentLink4URL: https://datasheet.ciiva.com/22747/1018594-22747512.pdf?src-supplier=Element14; ComponentLink4Description: https://datasheet.ciiva.com/22747/1018594-22747512.pdf?src-supplier=Element14; ComponentLink5URL: https://datasheet.ciiva.com/12667/pyu-rc0402-51-rohs-l-6-r-12667067.pdf?src-supplier=Mouser; ComponentLink5Description: https://datasheet.ciiva.com/12667/pyu-rc0402-51-rohs-l-6-r-12667067.pdf?src-supplier=Mouser; ComponentLink6URL: https://datasheet.ciiva.com/7849/1784430-7849813.pdf?src-supplier=Element14; ComponentLink6Description: https://datasheet.ciiva.com/7849/1784430-7849813.pdf?src-supplier=Element14; ComponentLink7URL: https://datasheet.ciiva.com/7849/1784430-7849815.pdf?src-supplier=Element14; ComponentLink7Description: https://datasheet.ciiva.com/7849/1784430-7849815.pdf?src-supplier=Element14; Supplier Part Number 1: 603-RC0402FR-0710KL; LCSC Part Number: C60490
R113 R116 = RC0402FR-07240RL: RES 240 OHM 1% 1/16W 0402; Manufacturer: Yageo; Item Type: Resistors; Power Rating: 63mW; Temperature Coefficient: 100ppm/°C; Voltage Rating (DC): 50V; Supplier 1: Mouser; Manufacturer Part Number: RC0402FR-07240RL; RoHS: Yes; Stock 1: 1903202; Pricing 1: 1=0.10000, 10=0.01200, 50=0.01200, 100=0.00500, 1000=0.00300, 10000=0.00100 (USD); Case/Package: 0402; Case Code (Metric): 1005; Case Code (Imperial): 0402; Size Code: 0402; Min Operating Temperature: -55°C; Max Operating Temperature: 155°C; Resistance: 240R; Tolerance: 1%; Packaging: Tape and Reel; Resistor Type: Thick Film; Voltage Rating: 50V; Package Quantity: 1; Number of Terminations: 2; Termination: SMD/SMT; Max Power Dissipation: 63mW; Features: Moisture Resistant; Series: RC; Construction: Rectangular; Resistance Tolerance: 1%; Length: 1mm; Width: 0.02inch; Height: 0.016inch; Depth: 0.5mm; REACH SVHC: Unknown; Lead Free: Lead Free; RoHS Compliant: Yes; Military Standard: Not; ComponentLink1URL: https://datasheet.ciiva.com/7849/1018594-7849915.pdf?src-supplier=Element14; ComponentLink1Description: https://datasheet.ciiva.com/7849/1018594-7849915.pdf?src-supplier=Element14; ComponentLink2URL: https://datasheet.ciiva.com/7849/1018594-7849916.pdf?src-supplier=Element14; ComponentLink2Description: https://datasheet.ciiva.com/7849/1018594-7849916.pdf?src-supplier=Element14; ComponentLink3URL: https://datasheet.ciiva.com/2519/pyu-r-int-thick-7-2519157.pdf?src-supplier=Digi-Key; ComponentLink3Description: https://datasheet.ciiva.com/2519/pyu-r-int-thick-7-2519157.pdf?src-supplier=Digi-Key; ComponentLink4URL: https://datasheet.ciiva.com/2519/pyu-r-int-thick-7-2519158.pdf?src-supplier=Digi-Key; ComponentLink4Description: https://datasheet.ciiva.com/2519/pyu-r-int-thick-7-2519158.pdf?src-supplier=Digi-Key; ComponentLink5URL: https://datasheet.ciiva.com/2519/pyu-r-int-thick-7-2519156.pdf?src-supplier=Digi-Key; ComponentLink5Description: https://datasheet.ciiva.com/2519/pyu-r-int-thick-7-2519156.pdf?src-supplier=Digi-Key; ComponentLink6URL: https://datasheet.ciiva.com/12669/pyu-rc0402-51-rohs-l-6-r-12669689.pdf?src-supplier=Mouser; ComponentLink6Description: https://datasheet.ciiva.com/12669/pyu-rc0402-51-rohs-l-6-r-12669689.pdf?src-supplier=Mouser; ComponentLink7URL: https://datasheet.ciiva.com/17419/pyu-rc0402-51-rohs-l-6-r-17419482.pdf?src-supplier=Future+Electronics; ComponentLink7Description: https://datasheet.ciiva.com/17419/pyu-rc0402-51-rohs-l-6-r-17419482.pdf?src-supplier=Future+Electronics; Supplier Part Number 1: 603-RC0402FR-07240RL; LCSC Part Number: C114755
R114 = RT0402BRD0726K1L: RES SMD 26.1KOHM 0.1% 1/16W 0402
R118 = RC0603FR-0730K1L: RES 30.1K OHM 1% 1/10W 0603; Manufacturer: Yageo; Item Type: Resistor; Supplier: Future Electronics; Supplier Part Number: 5666516; Manufacturer Part Number: RC0603FR-0730K1L; RoHS: Yes; Category: Chip SMD Resistors; Stock: 2160000; Pricing: 5000=0.0015, 50000=0.0014, 200000=0.0014, 625000=0.0013, 2000000=0.0012 (USD); ComponentLink1URL: https://datasheet.ciiva.com/11808/0900766b80f96399-11808101.pdf?src-supplier=Rs; ComponentLink1Description: https://datasheet.ciiva.com/11808/0900766b80f96399-11808101.pdf?src-supplier=Rs; LCSC Part Number: C137745
R119 = RT0402BRD07232RL: RES SMD 232 OHM 0.1% 1/16W 0402
R121 = RC1206FR-073K6L: RES SMD 3.6KOHM 1% 1/4W 1206
R122 = RT0402BRD07332RL: RES SMD 332 OHM 0.1% 1/16W 0402
R124 = RC0402FR-070RL: RES 0 OHM JUMPER 1/16W 0402; Manufacturer: Yageo; Item Type: Resistors; Tolerance: 1%; Power Rating: 62.5mW; Voltage Rating: 50V; Temperature Coefficient: 200ppm/°C; Max Power Dissipation: 63mW; Supplier 1: Mouser; Manufacturer Part Number: RC0402FR-070RL; RoHS: Yes; Stock 1: 8556842; Pricing 1: 1=0.10000, 10=0.01400, 50=0.01400, 100=0.00600, 1000=0.00300, 5000=0.00200, 10000=0.00100 (USD); Mount: Surface Mount; Case/Package: 0402; Contact Plating: Tin,Matte; Case Code (Imperial): 0402; Case Code (Metric): 1005; Size Code: 0402; Min Operating Temperature: -55°C; Max Operating Temperature: 155°C; Resistance: 0R; Resistor Type: Thick Film; Packaging: Tape and Reel; Termination: SMD/SMT; Features: Moisture Resistant; Series: RC; Number of Terminations: 2; Length: 1mm; Width: 0.5mm; Height: 0.35mm; Radiation Hardening: No; Lead Free: Lead Free; RoHS Compliant: Yes; ComponentLink1URL: https://datasheet.ciiva.com/8896/pyu-rc0402-51-rohs-l-6-8896149.pdf?src-supplier=Avnet; ComponentLink1Description: https://datasheet.ciiva.com/8896/pyu-rc0402-51-rohs-l-6-8896149.pdf?src-supplier=Avnet; ComponentLink2URL: https://datasheet.ciiva.com/16790/pyu-rc0402-51-rohs-l-6-r-16790444.pdf?src-supplier=Future+Electronics; ComponentLink2Description: https://datasheet.ciiva.com/16790/pyu-rc0402-51-rohs-l-6-r-16790444.pdf?src-supplier=Future+Electronics; Supplier Part Number 1: 603-RC0402FR-070RL; LCSC Part Number: C106231
R130 = RL1206FR-070R025L: RES 0.025 OHM 1% 1/4W 1206; Manufacturer: Yageo; Item Type: Resistors; Supplier: Future Electronics; LCSC Part Number: C326782; Manufacturer Part Number: RL1206FR-070R025L; RoHS: Yes; Stock: 10000; Pricing: 5000=0.0693, 10000=0.0682, 20000=0.0672, 25000=0.0668, 75000=0.0648 (USD); Lead Free: 5697LeadFree; ComponentLink1URL: https://datasheet.ciiva.com/15329/pyu-rl-521-rohs-l-5-15329020.pdf?src-supplier=Mouser; ComponentLink1Description: https://datasheet.ciiva.com/15329/pyu-rl-521-rohs-l-5-15329020.pdf?src-supplier=Mouser; ComponentLink2URL: https://datasheet.ciiva.com/8889/pyu-rl-521-rohs-l-5-8889981.pdf?src-supplier=Avnet; ComponentLink2Description: https://datasheet.ciiva.com/8889/pyu-rl-521-rohs-l-5-8889981.pdf?src-supplier=Avnet
R131 R136 = RT0402BRD07162KL: RES SMD 162K OHM 0.1% 1/16W 0402; Manufacturer: Yageo; Value: 162kR; Max Power Dissipation: 63mW; Temperature Coefficient: 25ppm/°C; Item Type: Resistor; Supplier 1: Future Electronics; Manufacturer Part Number: RT0402BRD07162KL; RoHS: Yes; Category: Chip SMD Resistors; Stock 1: 20000; Pricing 1: 10000=0.0218, 20000=0.0213, 30000=0.021, 50000=0.0206, 100000=0.0199 (USD); Case/Package: 0402; Min Operating Temperature: -55°C; Max Operating Temperature: 155°C; Packaging: Tape and Reel; Number of Terminations: 2; Tolerance: 0.1%; Features: Moisture Resistant; Series: RT; Length: 0.039inch; Width: 0.02inch; Height: 0.014inch; RoHS Compliant: Yes; ComponentLink1URL: http://www.yageo.com/documents/recent/PYu-RT_1-to-0.01_RoHS_L_8.pdf?src-supplier=Digi-Key; ComponentLink1Description: http://www.yageo.com/documents/recent/PYu-RT_1-to-0.01_RoHS_L_8.pdf?src-supplier=Digi-Key; Supplier Part Number 1: 3159372; LCSC Part Number: C852551
R132 = RC0402FR-07100KL: RES 100K OHM 1% 1/16W 0402; Manufacturer: Yageo; Resistance: 100kR; Temperature Coefficient: 100ppm/°C; Power Rating: 63mW; Voltage Rating: 50V; Item Type: Resistor; Supplier 1: Mouser; Manufacturer Part Number: RC0402FR-07100KL; RoHS: Yes; Category: Chip SMD Resistors; Stock 1: 7759549; Pricing 1: 1=0.10000, 10=0.01200, 50=0.01200, 100=0.00500, 1000=0.00300, 2500=0.00200, 10000=0.00100 (USD); Case/Package: 0402; Case Code (Metric): 1005; Case Code (Imperial): 0402; Min Operating Temperature: -55°C; Max Operating Temperature: 155°C; Resistor Type: Thick Film; Tolerance: 1%; Packaging: Tape and Reel; Package Quantity: 1; Number of Terminations: 2; Termination: SMD/SMT; Max Power Dissipation: 63mW; Working Voltage: 50V; Features: Moisture Resistant; Series: RC; Resistance Tolerance: 1%; Construction: Rectangular; Technology: THICK FILM; Length: 0.039inch; Width: 0.02inch; Height: 0.016inch; Depth: 0.5mm; REACH SVHC: No SVHC; Lead Free: Lead Free; RoHS Compliant: Yes; Military Standard: Not; ComponentLink1URL: https://datasheet.ciiva.com/11819/0900766b80c66297-11819452.pdf?src-supplier=RSComponents; ComponentLink1Description: https://datasheet.ciiva.com/11819/0900766b80c66297-11819452.pdf?src-supplier=RSComponents; ComponentLink2URL: https://datasheet.ciiva.com/22747/1018594-22747509.pdf?src-supplier=Element14; ComponentLink2Description: https://datasheet.ciiva.com/22747/1018594-22747509.pdf?src-supplier=Element14; ComponentLink3URL: https://datasheet.ciiva.com/2453/pyu-r-int-thick-7-2453362.pdf?src-supplier=Digi-Key; ComponentLink3Description: https://datasheet.ciiva.com/2453/pyu-r-int-thick-7-2453362.pdf?src-supplier=Digi-Key; ComponentLink4URL: https://datasheet.ciiva.com/2453/pyu-r-int-thick-7-2453363.pdf?src-supplier=Digi-Key; ComponentLink4Description: https://datasheet.ciiva.com/2453/pyu-r-int-thick-7-2453363.pdf?src-supplier=Digi-Key; ComponentLink5URL: https://datasheet.ciiva.com/2453/pyu-r-int-thick-7-2453361.pdf?src-supplier=Digi-Key; ComponentLink5Description: https://datasheet.ciiva.com/2453/pyu-r-int-thick-7-2453361.pdf?src-supplier=Digi-Key; ComponentLink6URL: https://datasheet.ciiva.com/12667/pyu-rc0402-51-rohs-l-6-r-12667930.pdf?src-supplier=Mouser; ComponentLink6Description: https://datasheet.ciiva.com/12667/pyu-rc0402-51-rohs-l-6-r-12667930.pdf?src-supplier=Mouser; ComponentLink7URL: https://datasheet.ciiva.com/15189/getdatasheetpartid-323696-15189334.pdf?src-supplier=Verical; ComponentLink7Description: https://datasheet.ciiva.com/15189/getdatasheetpartid-323696-15189334.pdf?src-supplier=Verical; Supplier Part Number 1: 603-RC0402FR-07100KL; LCSC Part Number: C60491
R135 = RC0402FR-075KL: RES 5K OHM 1% 1/16W 0402; Manufacturer: Yageo; Voltage Rating: 50V; Supplier: Future Electronics; Supplier Part Number: 4034282; Manufacturer Part Number: RC0402FR-075KL; RoHS: Yes; Category: Chip SMD Resistors; Stock: 10000; Pricing: 10000=0.0012, 100000=0.0011, 300000=0.001, 750000=0.001, 2000000=0.0009 (USD); ComponentLink1URL: https://datasheet.octopart.com/RC0402FR-075KL-Yageo-datasheet-164759695.pdf?src-supplier=Future+Electronics; ComponentLink1Description: https://datasheet.octopart.com/RC0402FR-075KL-Yageo-datasheet-164759695.pdf?src-supplier=Future+Electronics; ComponentLink2URL: http://www.yageo.com/documents/recent/PYu-RC_Group_51_RoHS_L_9.pdf?src-supplier=Digikey; ComponentLink2Description: http://www.yageo.com/documents/recent/PYu-RC_Group_51_RoHS_L_9.pdf?src-supplier=Digikey
T2 = 7490220123: WE-LAN LAN Transformer, SMT, 1000 Base-T, 1 Port, 200uH; Manufacturer: Wurth Elektronik; HPLE: No; Insulation Test Voltage: 1500Vrms; Number of Ports: 1; PoE: 4PPoE (up to 1500 mA); Turns Ratio: 1:1; Manufacturer Part Number: 7490220123; Category: Signal Transformers; Match Code: WE-LAN; ComponentLink1Description: Website Link; ComponentLink1URL: https://www.we-online.com/redexpert/article/7490220123?ad; ComponentLink2Description: Datasheet Link; ComponentLink2URL: https://www.we-online.com/redexpert/spec/7490220123?ad; Mount: Surface Mount; Operating Temperature Max: 105°C; Operating Temperature Min: -40°C; Packaging: Tape and Reel; Length: 18.29mm; Width: 14.7mm; Height: 8.8mm; Data Rate: 1000 Base-T; Inductance: 200uH
TP3 = 0.5mm Test Pad: Test pad
TP4 = TEST POINT 0.5mm Dia: Test Point ON; Item Type: Test Point; Manufacturer Part Number: TEST POINT 0.5mm Dia
U7 = NCP1095DBR2: IC POE CNTRL 1 CHANNEL 16TSSOP; Manufacturer: ON Semiconductor; Supplier: Digikey; LCSC Part Number: C904377; Manufacturer Part Number: NCP1095DBR2; RoHS: Yes; Item Type: IC; Stock: 19; Pricing: 1=2.7, 10=1.71, 25=1.462, 100=1.1886, 250=1.05764, 500=0.97836, 1000=0.91278 (USD)
U8-U11 = BC846BPDW1T1G: Bipolar (BJT) Transistor Array NPN, PNP 45V 100mA 100MHz 380mW Surface Mount SC-88/SC70-6/SOT-363; Package: None; Price: None; Value: *; MP: BC846BPDW1T1G; Availability: Unavailable